# Altium schematic sheet ORing Controller.SchDoc
size B; SheetNumber: 2; SheetTotal: 5
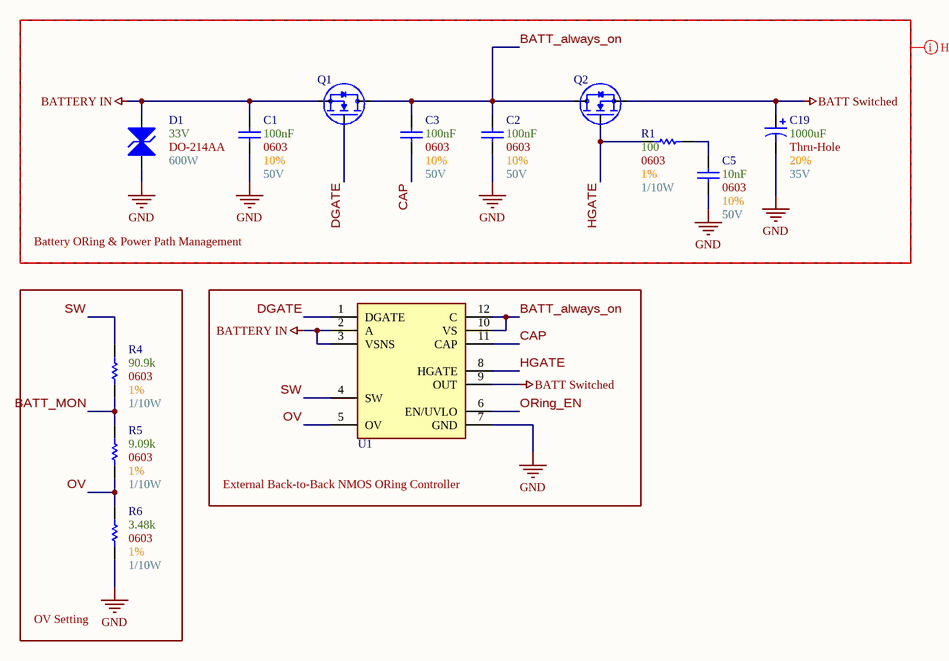
[diagram p0: ORing Controller.SchDoc]

## Parts
C1  Max Voltage: 50V  Size Package: 0603  Tolerance: 10%  Capacitance: 100nF  [[Cap] SMD 0603]  (hidden comment: [Cap] 0603 0.1uF 10% 50V)
C2  Max Voltage: 50V  Size Package: 0603  Tolerance: 10%  Capacitance: 100nF  [[Cap] SMD 0603]  (hidden comment: [Cap] 0603 0.1uF 10% 50V)
C3  Max Voltage: 50V  Size Package: 0603  Tolerance: 10%  Capacitance: 100nF  [[Cap] SMD 0603]  (hidden comment: [Cap] 0603 0.1uF 10% 50V)
C5  Max Voltage: 50V  Size Package: 0603  Tolerance: 10%  Capacitance: 10nF  [[Cap] SMD 0603]  (hidden comment: [Cap] 0603 0.01uF 10% 50V)
C19  Max Voltage: 35V  Size Package: Thru-Hole  Tolerance: 20%  Capacitance: 1000uF  [[Cap] Thru-Hole Right-Angle Polarized 10mm]  (hidden comment: [Cap] Thru-Hole 1000uF 20% 35V)
D1  Wattage: 600W  Optimal Zener Voltage: 33V  [[Diode] SMD DO-214AA]  (hidden comment: DO-214AA)
Q1  [NMOS] SMD 40V 175A 0.55mOhm  [[NMOS] SMD 40V 175A 0.55mOhm]  (value not drawn)
Q2  [NMOS] SMD 40V 175A 0.55mOhm  [[NMOS] SMD 40V 175A 0.55mOhm]  (value not drawn)
R1  Wattage: 1/10W  Tolerance: 1%  Resistance: 100  Size Package: 0603  [[Res] SMD 0603]  (hidden comment: [100] SMD 0603 1% 1/10W)
R4  Wattage: 1/10W  Tolerance: 1%  Resistance: 90.9k  Size Package: 0603  [[Res] SMD 0603]  (hidden comment: [90.9k] SMD 0603 1% 1/10W)
R5  Wattage: 1/10W  Tolerance: 1%  Resistance: 9.09k  Size Package: 0603  [[Res] SMD 0603]  (hidden comment: [9.09k] SMD 0603 1% 1/10W)
R6  Wattage: 1/10W  Tolerance: 1%  Resistance: 3.48k  Size Package: 0603  [[Res] SMD 0603]  (hidden comment: [3.48k] SMD 0603 1% 1/10W_1)
U1  [ORing] Back-to-Back External NMOS Controller  [[ORing] Back-to-Back External NMOS Controller]  (value not drawn)

## Blocks framed on the sheet
Battery ORing & Power Path Management: C1-C3 C5 C19 D1 Q1 Q2 R1
OV Setting: R4-R6
External Back-to-Back NMOS ORing Controller: U1

## Nets
BATT Switched: C19.1 Q2.1(Source) U1.9(OUT)
BATTERY IN: C1.2 D1.2(K) Q1.1(Source) U1.2(A) U1.3(VSNS)
GND: C1.1 C2.1 C5.1 C19.2 D1.1(A) R6.2 U1.7(GND)
BATT_always_on: C2.2 C3.2 Q1.3(Drain) Q2.3(Drain) U1.10(VS) U1.12(C)
BATT_MON: R4.1 R5.2
CAP: C3.1 U1.11(CAP)
DGATE: Q1.2(Gate) U1.1(DGATE)
HGATE: Q2.2(Gate) R1.1 U1.8(HGATE)
ORing_EN: U1.6(EN/UVLO)
OV: R5.1 R6.1 U1.5(OV)
SW: R4.2 U1.4(SW)
NetC5_2: C5.2 R1.2

## Layout directives
net class High_Current_Nets: BATT Switched, BATT_always_on, BATTERY IN, CAP, DGATE, GND, HGATE

## Library data of the parts
C1-C3 = [Cap] 0603 0.1uF 10% 50V: CL10B104KB8NNNC; Supplier 1: DigiKey; Supplier Part Number 1: 1276-1000-6-ND
C5 = [Cap] 0603 0.01uF 10% 50V: C0603C103K5RACTU; Supplier 1: DigiKey; Supplier Part Number 1: 399-C0603C103K5RACTUDKR-ND
C19 = [Cap] Thru-Hole 1000uF 20% 35V: 35PK1000MEFC10X20; Supplier 1: DigiKey; Supplier Part Number 1: 1189-1742-ND
D1 = [TVS] SMBJ33CA: SMBJ33CA; Supplier 1: DigiKey; Supplier Part Number 1: SMBJ33CA-FDICT-ND; Footprint: DO-214AA
Q1 Q2 = [NMOS] SMD 40V 175A 0.55mOhm: IAUCN04S7N005ATMA1; Supplier 1: DigiKey; Supplier Part Number 1: 448-IAUCN04S7N005ATMA1CT-ND
R1 = [100] SMD 0603 1% 1/10W: RC0603FR-07100RL; Supplier 1: DigiKey; Supplier Part Number 1: 311-100HRDKR-ND
R4 = [90.9k] SMD 0603 1% 1/10W: CR0603-FX-9092ELF; Supplier 1: DigiKey; Supplier Part Number 1: CR0603-FX-9092ELFCT-ND
R5 = [9.09k] SMD 0603 1% 1/10W: RMCF0603FT9K09; Supplier 1: DigiKey; Supplier Part Number 1: RMCF0603FT9K09CT-ND
R6 = [3.48k] SMD 0603 1% 1/10W_1: RMCF0603FT3K48; Supplier 1: DigiKey; Supplier Part Number 1: RMCF0603FT3K48CT-ND
U1 = [ORing] Back-to-Back External NMOS Controller: LM74810QDRRRQ1; Supplier 1: DigiKey; Supplier Part Number 1: 296-LM74810QDRRRQ1CT-ND